# Altium schematic sheet RS485.SchDoc
size A; SheetNumber: 5; SheetTotal: 9
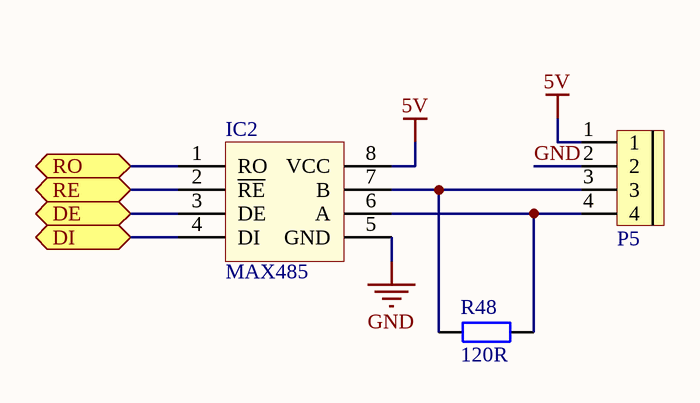
[diagram p0: RS485.SchDoc]

## Parts
IC2  MAX485  [DIP8/W0.3]
P5  CON 4 EDG5.08  [CON 4 4EDG5.08]  (value not drawn)
R48  120R  [tro smd 0805]

## Ports
DE (bidir), DI (bidir), RE (bidir), RO (bidir)

## Nets
5V: IC2.8(VCC) P5.1
GND: IC2.5(GND) P5.2
DE: IC2.3(DE) ; port DE
DI: IC2.4(DI) ; port DI
RE: IC2.2(~{RE}) ; port RE
RO: IC2.1(RO) ; port RO
NetIC2_6: IC2.6(A) P5.4 R48.2
NetIC2_7: IC2.7(B) P5.3 R48.1

## Library data of the parts
IC2 = MAX485: RS232 - RS485 (Same sn75176)
P5 = CON 4 EDG5.08: Cắm; Ten_Linh_Kien: CON 4 2EDG5.08-4P 5.08MM ( Xanh Cong); Ma_Hang: MH000979; Don_Vi: Con; Ghi_Chu: *; Kieu_Chan: *; Chung_Loai: Cắm
R48 = Tro 0805 5% 120R: Dán; Don_Vi: Con; So_Chan: 2; Ten_Linh_Kien: Trở 0805 5% 120R; Ma_Hang: MH005253; Chung_Loai: Dán; Kieu_Chan: *